# EasyEDA Pro project YT9215S-5-port-switch.epro, board PCB1
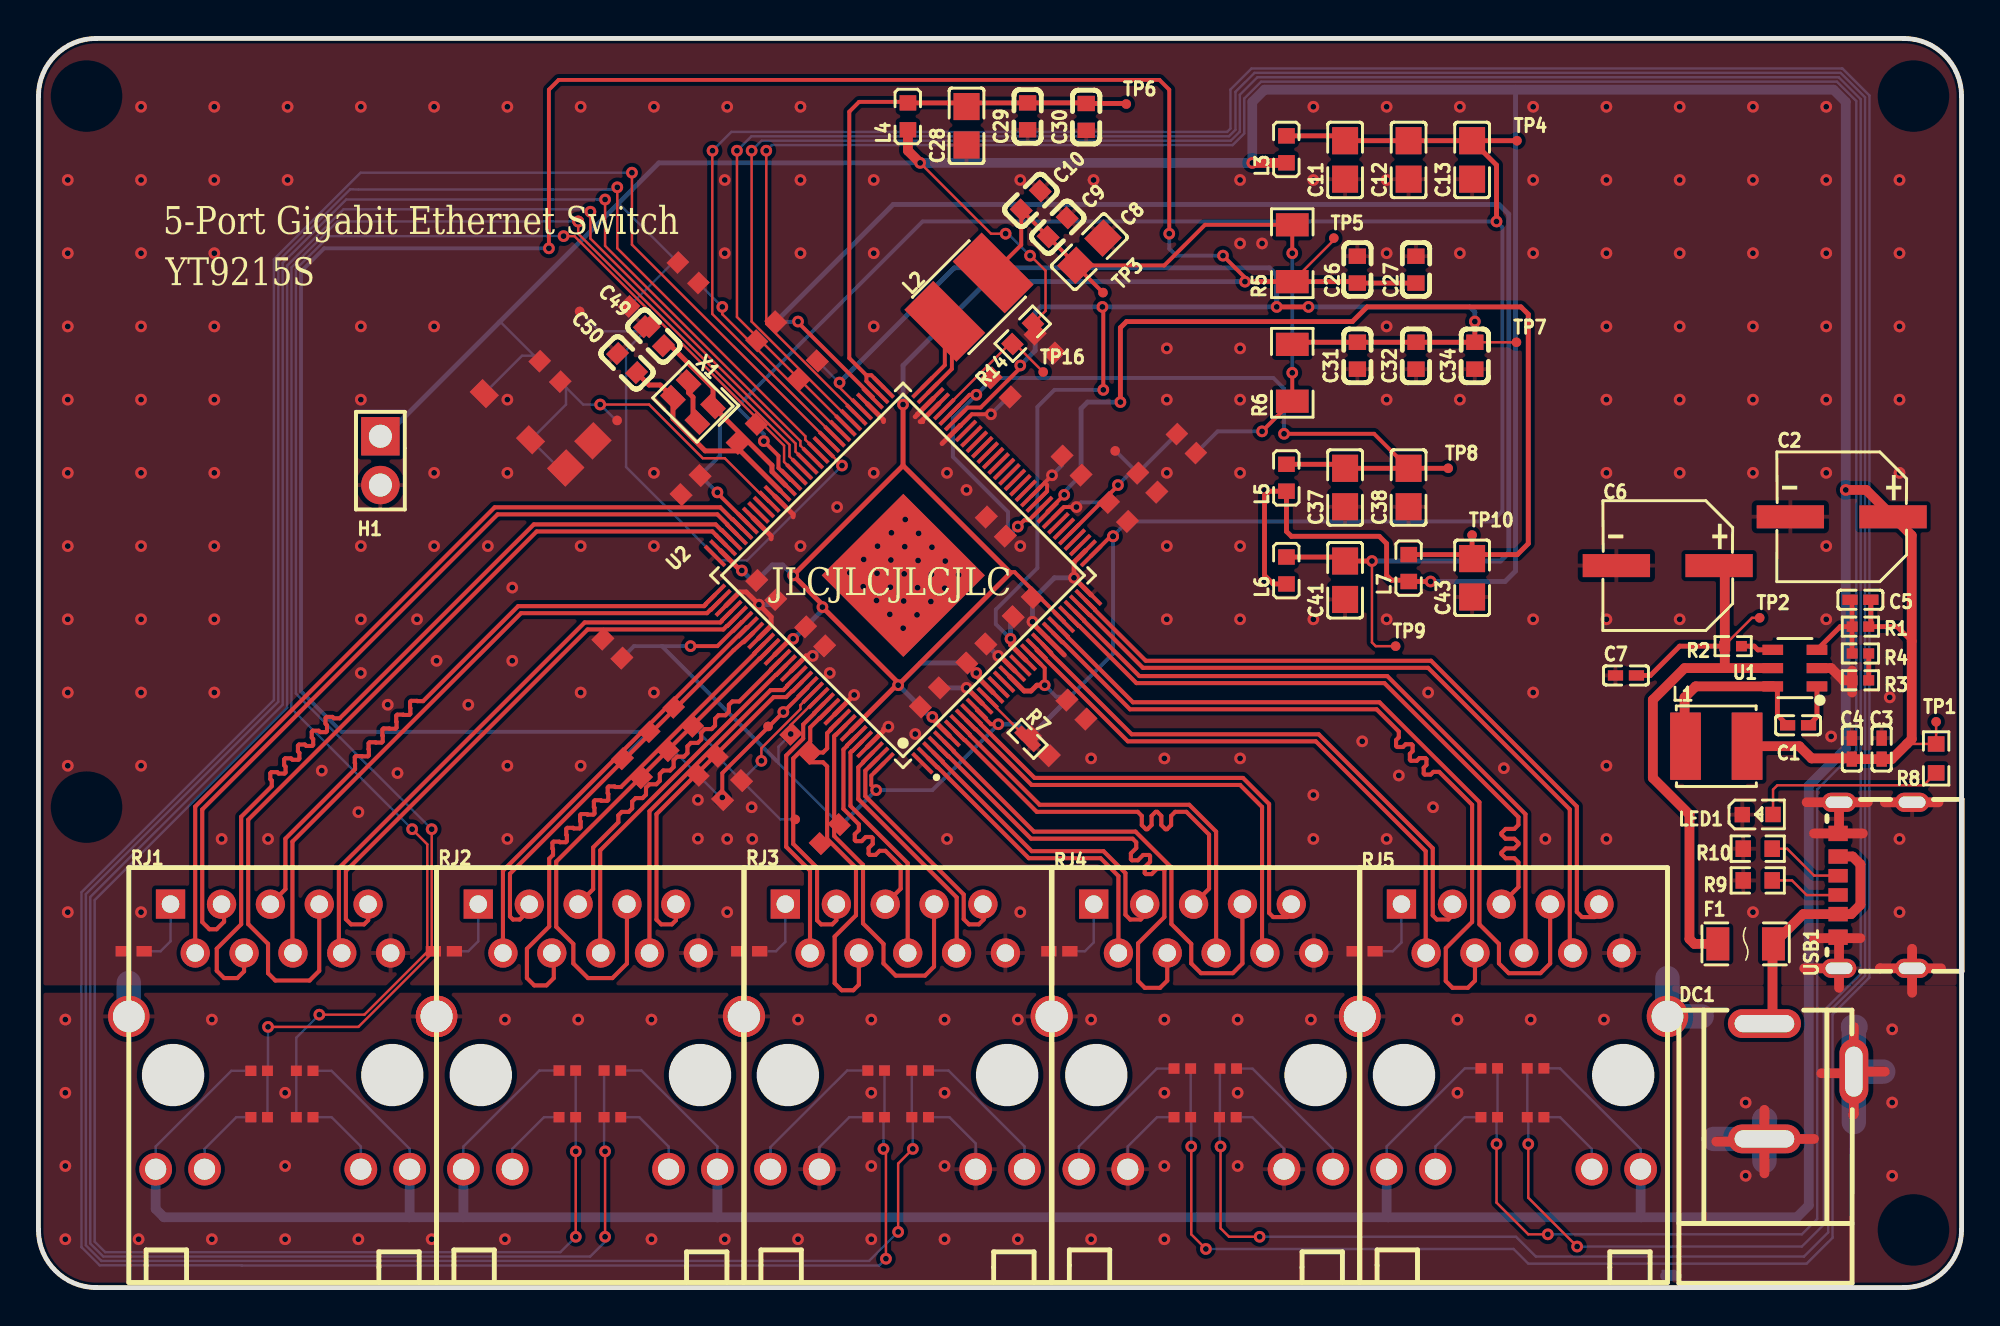
[diagram p2: board, top side]
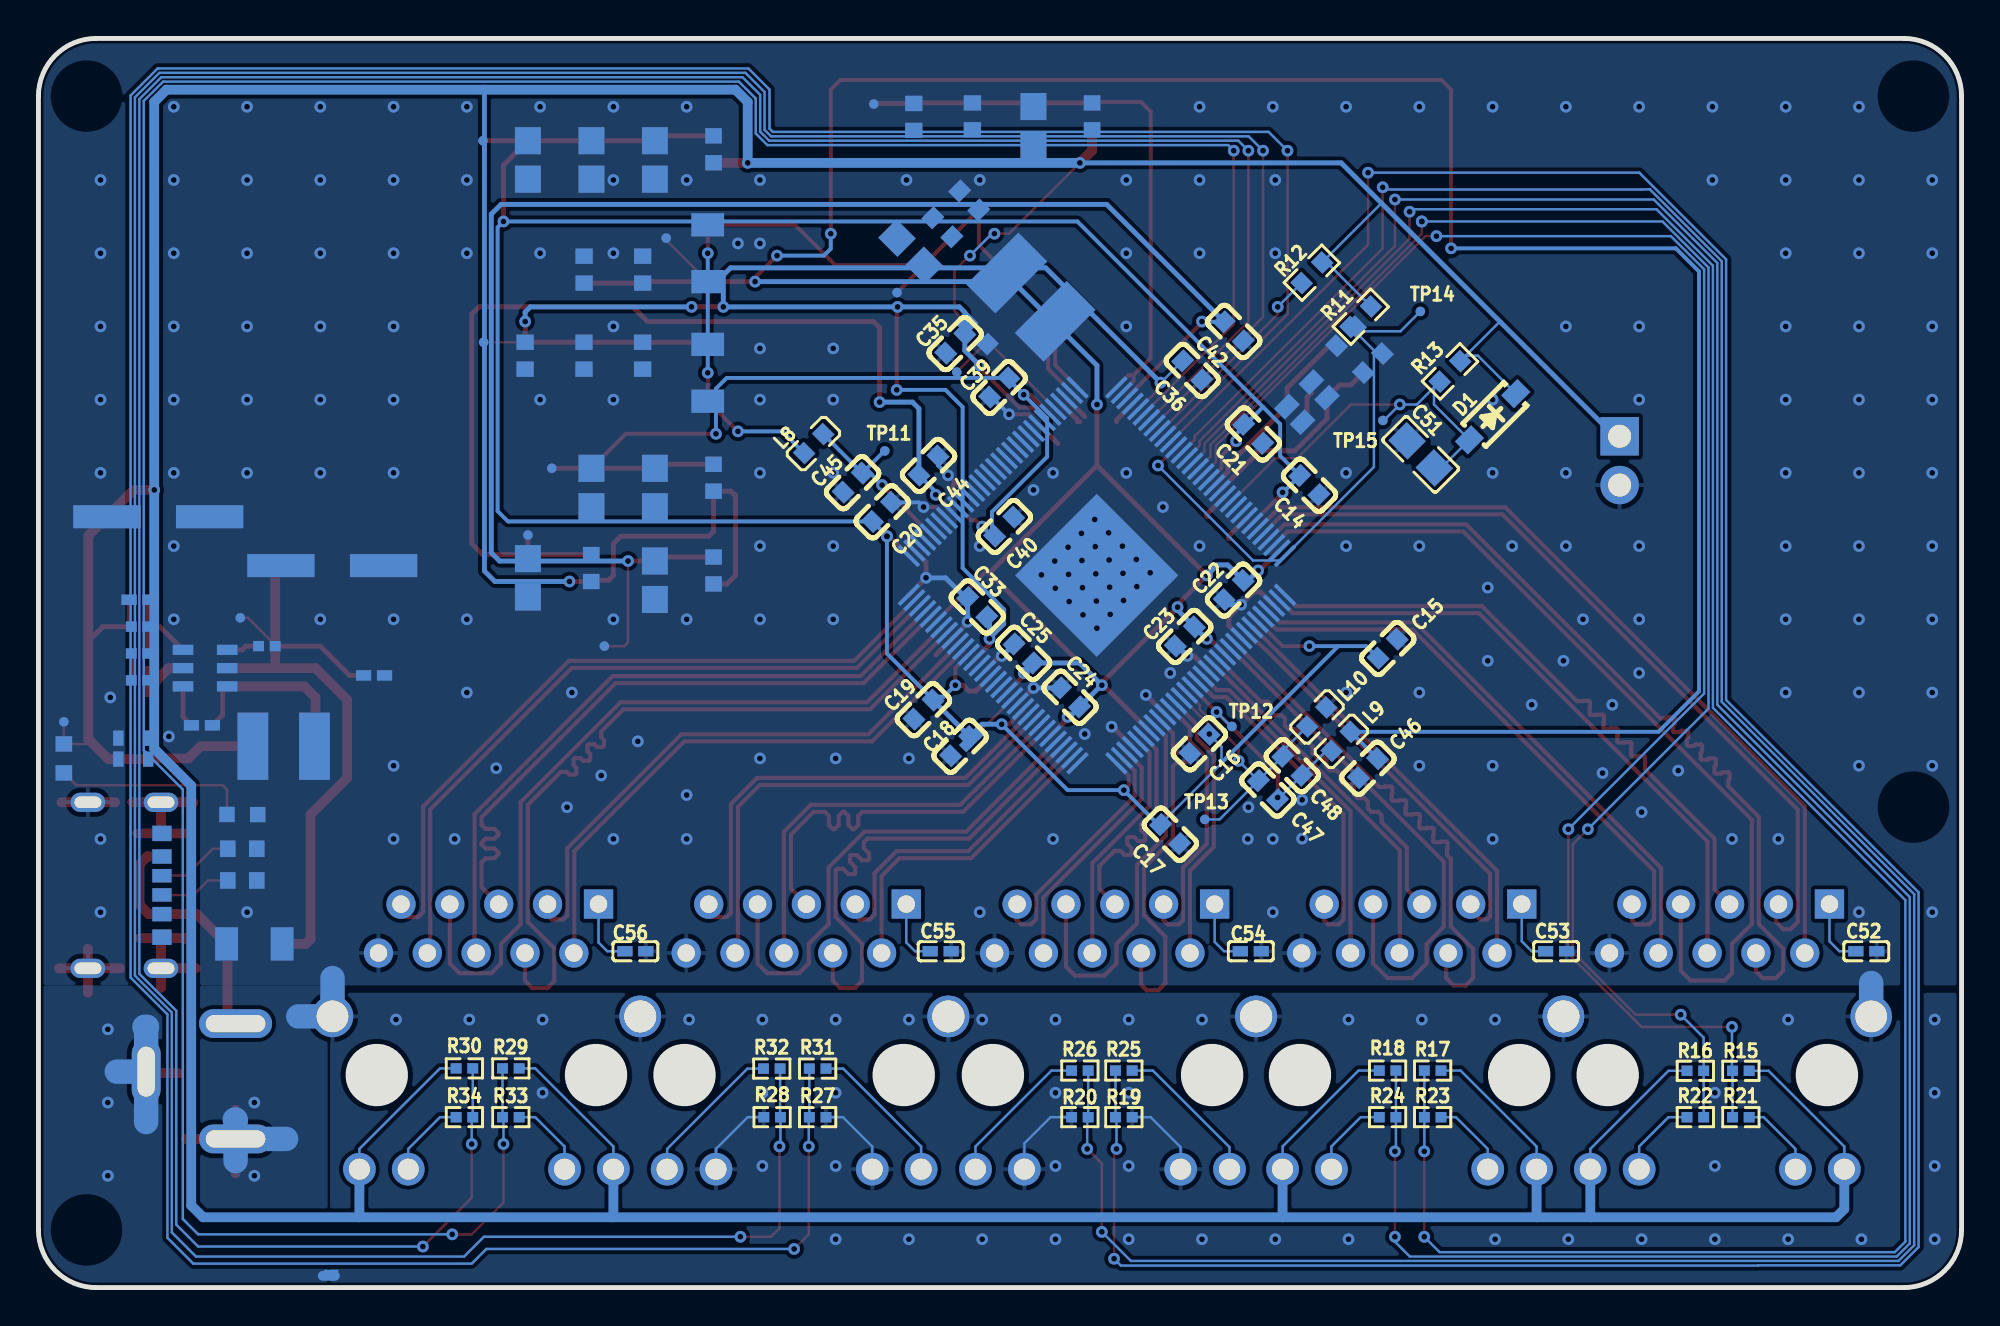
[diagram p3: board, bottom side, seen from below]

Outline 100 x 65 mm; copper layers: Top Layer, Bottom Layer. Coordinates in mm from the lower left corner of the outline.
Outline path: 0,62 0,3 arc(0.88,0.88) 3,0 97,0 arc(99.12,0.88) 100,3 100,62 arc(99.12,64.12) 97,65 3,65 arc(0.88,64.12) 0,62
Stack: Top Layer 0.035mm / Dielectric1 1.51mm FR4 er 4.5 / Bottom Layer 0.035mm

## Design rules (mm)
net P3MDIA_P: P3MDIA
net P3MDIA_N: P3MDIA
net P3MDIB_P: P3MDIB
net P3MDIB_N: P3MDIB
net P3MDIC_P: P3MDIC
net P3MDIC_N: P3MDIC
net P3MDID_P: P3MDID
net P3MDID_N: P3MDID
net P4MDIA_P: P4MDIA
net P4MDIA_N: P4MDIA
net P4MDIB_P: P4MDIB
net P4MDIB_N: P4MDIB
net P4MDIC_P: P4MDIC
net P4MDIC_N: P4MDIC
net P4MDID_P: P4MDID
net P4MDID_N: P4MDID
net P0MDIA_P: P0MDIA
net P0MDIA_N: P0MDIA
net P0MDIB_P: P0MDIB
net P0MDIB_N: P0MDIB
net P0MDIC_P: P0MDIC
net P0MDIC_N: P0MDIC
net P0MDID_P: P0MDID
net P0MDID_N: P0MDID
net P1MDIA_P: P1MDIA
net P1MDIA_N: P1MDIA
net P1MDIB_P: P1MDIB
net P1MDIB_N: P1MDIB
net P1MDIC_P: P1MDIC
net P1MDIC_N: P1MDIC
net P1MDID_P: P1MDID
net P1MDID_N: P1MDID
net P2MDIA_P: P2MDIA
net P2MDIA_N: P2MDIA
net P2MDIB_P: P2MDIB
net P2MDIB_N: P2MDIB
net P2MDIC_P: P2MDIC
net P2MDIC_N: P2MDIC
net P2MDID_P: P2MDID
net P2MDID_N: P2MDID
spacing copperThickness1oz (default): track to track 0.102, other pairs 0.152 to 0.3
spacing copperThickness2oz: track to track 0.203, other pairs 0.152 to 0.3
spacing Plane_innerPlane: track to track 0.102, other pairs 0.152 to 0.3
spacing Copper_copperRegion: track to track 0.102, other pairs 0.152 to 0.3
track width copperThickness1oz (default): min 0.127, default 0.254, max 2.54
track width copperThickness2oz: min 0.203, default 0.254, max 2.54
differential pair differentialPair (default): width min 0.127, default 0.254, max 2.54; gap min 0.152, default 0.152
differential pair 100欧姆共面差分阻抗匹配: width min 0.127, default 0.213, max 2.54; gap min 0.152, default 0.152
net 3V3 uses Copper_copperRegion, Plane_innerPlane
net AVDDH uses Copper_copperRegion, Plane_innerPlane
net $1N2005 uses Copper_copperRegion, Plane_innerPlane
net GND uses Copper_copperRegion, Plane_innerPlane
net $1N2999 uses Copper_copperRegion, Plane_innerPlane
net VDDL uses Copper_copperRegion, Plane_innerPlane
net AVDDL uses Copper_copperRegion, Plane_innerPlane
net DVDDL uses Copper_copperRegion, Plane_innerPlane
net DVDDIO_2 uses Copper_copperRegion, Plane_innerPlane
net DVDDIO uses Copper_copperRegion, Plane_innerPlane
net SVDDH uses Copper_copperRegion, Plane_innerPlane
net SVDDL uses Copper_copperRegion, Plane_innerPlane
net PLLVDDL uses Copper_copperRegion, Plane_innerPlane
net PLLGND uses Copper_copperRegion, Plane_innerPlane
net V_BUS uses Copper_copperRegion, Plane_innerPlane
net $1N9819 uses Copper_copperRegion, Plane_innerPlane
net $1N9816 uses Copper_copperRegion, Plane_innerPlane
net XTAL_IN uses Copper_copperRegion, Plane_innerPlane
net XTAL_OUT uses Copper_copperRegion, Plane_innerPlane
net HV_SWR uses Copper_copperRegion, Plane_innerPlane
net NRST uses Copper_copperRegion, Plane_innerPlane
net EN_SWR uses Copper_copperRegion, Plane_innerPlane
net VBUS uses Copper_copperRegion, Plane_innerPlane
net $1N10186 uses Copper_copperRegion, Plane_innerPlane
net DISAUTOLOAD uses Copper_copperRegion, Plane_innerPlane
net EN_PWRLIGHT uses Copper_copperRegion, Plane_innerPlane
net $1N4949 uses Copper_copperRegion, Plane_innerPlane
net $1N4948 uses Copper_copperRegion, Plane_innerPlane
net $1N4945 uses Copper_copperRegion, Plane_innerPlane
net $1N4947 uses Copper_copperRegion, Plane_innerPlane
net P3MDIA_P uses 100欧姆共面差分阻抗匹配, Copper_copperRegion, Plane_innerPlane
net P3MDIA_N uses 100欧姆共面差分阻抗匹配, Copper_copperRegion, Plane_innerPlane
net P3MDIB_P uses 100欧姆共面差分阻抗匹配, Copper_copperRegion, Plane_innerPlane
net P3MDIB_N uses 100欧姆共面差分阻抗匹配, Copper_copperRegion, Plane_innerPlane
net P3MDIC_P uses 100欧姆共面差分阻抗匹配, Copper_copperRegion, Plane_innerPlane
net P3MDIC_N uses 100欧姆共面差分阻抗匹配, Copper_copperRegion, Plane_innerPlane
net P3MDID_P uses 100欧姆共面差分阻抗匹配, Copper_copperRegion, Plane_innerPlane
net P3MDID_N uses 100欧姆共面差分阻抗匹配, Copper_copperRegion, Plane_innerPlane
net P4MDIA_P uses 100欧姆共面差分阻抗匹配, Copper_copperRegion, Plane_innerPlane
net P4MDIA_N uses 100欧姆共面差分阻抗匹配, Copper_copperRegion, Plane_innerPlane
net P4MDIB_P uses 100欧姆共面差分阻抗匹配, Copper_copperRegion, Plane_innerPlane
net P4MDIB_N uses 100欧姆共面差分阻抗匹配, Copper_copperRegion, Plane_innerPlane
net P4MDIC_P uses 100欧姆共面差分阻抗匹配, Copper_copperRegion, Plane_innerPlane
net P4MDIC_N uses 100欧姆共面差分阻抗匹配, Copper_copperRegion, Plane_innerPlane
net P4MDID_P uses 100欧姆共面差分阻抗匹配, Copper_copperRegion, Plane_innerPlane
net P4MDID_N uses 100欧姆共面差分阻抗匹配, Copper_copperRegion, Plane_innerPlane
net P4_LED0 uses Copper_copperRegion, Plane_innerPlane
net P4_LED1 uses Copper_copperRegion, Plane_innerPlane
net P3_LED1 uses Copper_copperRegion, Plane_innerPlane
net P3_LED0 uses Copper_copperRegion, Plane_innerPlane
net P2_LED0 uses Copper_copperRegion, Plane_innerPlane
net P2_LED1 uses Copper_copperRegion, Plane_innerPlane
net P1_LED1 uses Copper_copperRegion, Plane_innerPlane
net P1_LED0 uses Copper_copperRegion, Plane_innerPlane
net P0_LED1 uses Copper_copperRegion, Plane_innerPlane
net P0_LED0 uses Copper_copperRegion, Plane_innerPlane
net P0MDIA_P uses 100欧姆共面差分阻抗匹配, Copper_copperRegion, Plane_innerPlane
net P0MDIA_N uses 100欧姆共面差分阻抗匹配, Copper_copperRegion, Plane_innerPlane
net P0MDIB_P uses 100欧姆共面差分阻抗匹配, Copper_copperRegion, Plane_innerPlane
net P0MDIB_N uses 100欧姆共面差分阻抗匹配, Copper_copperRegion, Plane_innerPlane
net P0MDIC_P uses 100欧姆共面差分阻抗匹配, Copper_copperRegion, Plane_innerPlane
net P0MDIC_N uses 100欧姆共面差分阻抗匹配, Copper_copperRegion, Plane_innerPlane
net P0MDID_P uses 100欧姆共面差分阻抗匹配, Copper_copperRegion, Plane_innerPlane
net P0MDID_N uses 100欧姆共面差分阻抗匹配, Copper_copperRegion, Plane_innerPlane
net P1MDIA_P uses 100欧姆共面差分阻抗匹配, Copper_copperRegion, Plane_innerPlane
net P1MDIA_N uses 100欧姆共面差分阻抗匹配, Copper_copperRegion, Plane_innerPlane
net P1MDIB_P uses 100欧姆共面差分阻抗匹配, Copper_copperRegion, Plane_innerPlane
net P1MDIB_N uses 100欧姆共面差分阻抗匹配, Copper_copperRegion, Plane_innerPlane
net P1MDIC_P uses 100欧姆共面差分阻抗匹配, Copper_copperRegion, Plane_innerPlane
net P1MDIC_N uses 100欧姆共面差分阻抗匹配, Copper_copperRegion, Plane_innerPlane
net P1MDID_P uses 100欧姆共面差分阻抗匹配, Copper_copperRegion, Plane_innerPlane
net P1MDID_N uses 100欧姆共面差分阻抗匹配, Copper_copperRegion, Plane_innerPlane
net P2MDIA_P uses 100欧姆共面差分阻抗匹配, Copper_copperRegion, Plane_innerPlane
net P2MDIA_N uses 100欧姆共面差分阻抗匹配, Copper_copperRegion, Plane_innerPlane
net P2MDIB_P uses 100欧姆共面差分阻抗匹配, Copper_copperRegion, Plane_innerPlane
net P2MDIB_N uses 100欧姆共面差分阻抗匹配, Copper_copperRegion, Plane_innerPlane
net P2MDIC_P uses 100欧姆共面差分阻抗匹配, Copper_copperRegion, Plane_innerPlane
net P2MDIC_N uses 100欧姆共面差分阻抗匹配, Copper_copperRegion, Plane_innerPlane
net P2MDID_P uses 100欧姆共面差分阻抗匹配, Copper_copperRegion, Plane_innerPlane
net P2MDID_N uses 100欧姆共面差分阻抗匹配, Copper_copperRegion, Plane_innerPlane
net $1N4938 uses Copper_copperRegion, Plane_innerPlane
net $2N653 uses Copper_copperRegion, Plane_innerPlane
net $2N647 uses Copper_copperRegion, Plane_innerPlane
net $2N645 uses Copper_copperRegion, Plane_innerPlane
net $2N1084 uses Copper_copperRegion, Plane_innerPlane
net $2N1078 uses Copper_copperRegion, Plane_innerPlane
net $2N1076 uses Copper_copperRegion, Plane_innerPlane
net $2N1523 uses Copper_copperRegion, Plane_innerPlane
net $2N6555 uses Copper_copperRegion, Plane_innerPlane
net $2N6448 uses Copper_copperRegion, Plane_innerPlane
net $2N1954 uses Copper_copperRegion, Plane_innerPlane
net $2N6593 uses Copper_copperRegion, Plane_innerPlane
net $2N6531 uses Copper_copperRegion, Plane_innerPlane
net $2N2385 uses Copper_copperRegion, Plane_innerPlane
net $2N2379 uses Copper_copperRegion, Plane_innerPlane
net $2N2377 uses Copper_copperRegion, Plane_innerPlane
diff pair P3MDIA uses 100欧姆共面差分阻抗匹配
diff pair P3MDIB uses 100欧姆共面差分阻抗匹配
diff pair P3MDIC uses 100欧姆共面差分阻抗匹配
diff pair P3MDID uses 100欧姆共面差分阻抗匹配
diff pair P4MDIA uses 100欧姆共面差分阻抗匹配
diff pair P4MDIB uses 100欧姆共面差分阻抗匹配
diff pair P4MDIC uses 100欧姆共面差分阻抗匹配
diff pair P4MDID uses 100欧姆共面差分阻抗匹配
diff pair P0MDIA uses 100欧姆共面差分阻抗匹配
diff pair P0MDIB uses 100欧姆共面差分阻抗匹配
diff pair P0MDIC uses 100欧姆共面差分阻抗匹配
diff pair P0MDID uses 100欧姆共面差分阻抗匹配
diff pair P1MDIA uses 100欧姆共面差分阻抗匹配
diff pair P1MDIB uses 100欧姆共面差分阻抗匹配
diff pair P1MDIC uses 100欧姆共面差分阻抗匹配
diff pair P1MDID uses 100欧姆共面差分阻抗匹配
diff pair P2MDIA uses 100欧姆共面差分阻抗匹配
diff pair P2MDIB uses 100欧姆共面差分阻抗匹配
diff pair P2MDIC uses 100欧姆共面差分阻抗匹配
diff pair P2MDID uses 100欧姆共面差分阻抗匹配
pour e1845 uses Copper_copperRegion
pour e2004 uses Copper_copperRegion
pour e2045 uses Copper_copperRegion
pour e2162 uses Copper_copperRegion
pour e2218 uses Copper_copperRegion
pour e2228 uses Copper_copperRegion

## Placement (name value [footprint] x y rotation side)
C1  22nF  [C0402]  91.5 29.26 180 top
C2  220uF  [CAP-SMD_BD6.3-L6.6-W6.6-LS7.4-FD]  93.77 40.11 180 top
C3  100nF  [C0402]  95.84 28.04 270 top
C4  10nF  [C0402]  94.3 28.04 270 top
C5  22pF  [C0402]  94.74 35.79 180 top
C6  220uF  [CAP-SMD_BD6.3-L6.6-W6.6-LS7.4-FD]  84.72 37.57 180 top
C7  100nF  [C0402]  82.55 31.85 0 top
C8  10uF  [C0805]  54.65 53.9 225 top
C9  10nF  [C0603]  53 55.17 225 top
C10  100nF  [C0603]  51.6 56.57 225 top
C11  10uF  [C0805]  67.94 58.68 90 top
C12  10uF  [C0805]  71.25 58.68 90 top
C13  10uF  [C0805]  74.55 58.68 90 top
C14  10nF  [C0603]  33.91 41.76 45 bottom
C15  10nF  [C0603]  29.84 33.25 315 bottom
C16  10nF  [C0603]  39.62 28.3 135 bottom
C17  10nF  [C0603]  41.15 23.6 45 bottom
C18  10nF  [C0603]  52.07 28.17 135 bottom
C19  10nF  [C0603]  53.97 30.08 135 bottom
C20  10nF  [C0603]  56.13 40.36 315 bottom
C21  10nF  [C0603]  36.83 44.43 45 bottom
C22  10nF  [C0603]  37.85 36.3 135 bottom
C23  10nF  [C0603]  40.39 33.89 135 bottom
C24  10nF  [C0603]  46.35 30.71 225 bottom
C25  10nF  [C0603]  48.77 33 225 bottom
C26  10nF  [C0603]  68.58 52.97 270 top
C27  10nF  [C0603]  71.63 52.97 270 top
C28  10uF  [C0805]  48.26 60.46 90 top
C29  1uF  [C0603]  51.44 60.95 90 top
C30  10nF  [C0603]  54.48 60.92 90 top
C31  10nF  [C0603]  68.59 48.49 90 top
C32  10nF  [C0603]  71.63 48.49 90 top
C33  10nF  [C0603]  51.18 35.41 225 bottom
C34  10nF  [C0603]  74.69 48.49 90 top
C35  10nF  [C0603]  52.32 49.12 135 bottom
C36  10nF  [C0603]  40 47.73 45 bottom
C37  10uF  [C0805]  67.94 41.63 90 top
C38  10uF  [C0805]  71.25 41.63 90 top
C39  10nF  [C0603]  50.04 46.84 135 bottom
C40  10nF  [C0603]  49.78 39.6 315 bottom
C41  10uF  [C0805]  67.94 36.81 90 top
C42  10nF  [C0603]  37.85 49.76 45 bottom
C43  10uF  [C0805]  74.55 36.93 90 top
C44  10nF  [C0603]  53.72 42.78 315 bottom
C45  10nF  [C0603]  57.66 41.89 135 bottom
C46  100nF  [C0603]  30.86 27.03 135 bottom
C47  1uF  [C0603]  36.07 25.88 225 bottom
C48  1nF  [C0603]  34.8 27.15 225 bottom
C49  4pF  [C0603]  32 49.51 315 top
C50  4pF  [C0603]  30.61 48.11 315 top
C51  10uF  [C0805]  28.12 43.36 225 bottom
C52  100nF  [C0402]  4.95 17.5 0 bottom
C53  100nF  [C0402]  21.08 17.5 0 bottom
C54  100nF  [C0402]  36.96 17.5 0 bottom
C55  100nF  [C0402]  53.09 17.5 0 bottom
C56  100nF  [C0402]  68.96 17.5 0 bottom
D1  1N4148WQ  [SOD-123_L2.7-W1.6-LS3.7-RD-1]  24.38 45.31 315 bottom
DC1  DC-005-20A  [DC-IN-TH_DC-005-20A]  92.07 10.74 90 top
F1  BSMD1206-075-30V  [F1206]  88.77 17.88 180 top
H1  PZ254V-11-02P  [HDR-TH_2P-P2.54-V-M]  17.78 43.03 270 top
L1  4.7uH  [IND-SMD_L4.0-W4.0]  87.25 28.17 0 top
L2  2.2uH  [IND-SMD_L4.0-W4.0_SWPA4018S]  48.39 51.54 225 top
L3  BLM18KG221SN1D  [L0603]  64.9 59.23 90 top
L4  BLM18KG221SN1D  [L0603]  45.21 60.95 90 top
L5  BLM18KG221SN1D  [L0603]  64.9 42.14 90 top
L6  BLM18KG221SN1D  [L0603]  64.9 37.31 90 top
L7  BLM18KG221SN1D  [L0603]  71.26 37.44 90 top
L8  BLM18KG221SN1D  [L0603]  59.69 43.92 135 bottom
L9  BLM18KG221SN1D  [L0603]  32.26 28.42 315 bottom
L10  BLM18KG221SN1D  [L0603]  33.53 29.69 315 bottom
LED1  NCD0603W1  [LED0603-RD]  89.4 24.61 0 top
NOREF  -  [Pad_e346]  44.97 37.06 45 top
R1  18kΩ  [R0402]  94.74 34.39 180 top
R2  10kΩ  [R0402]  88.12 33.38 0 top
R3  2kΩ  [R0402]  94.74 31.6 180 top
R4  2kΩ  [R0402]  94.74 33 0 top
R5  0Ω  [R1206]  65.2 53.82 270 top
R6  0Ω  [R1206]  65.2 47.6 90 top
R7  2.49kΩ  [R0402]  51.44 28.55 135 top
R8  150Ω  [R0603]  98.68 27.53 270 top
R9  5.1kΩ  [R0603]  89.4 21.19 180 top
R10  5.1kΩ  [R0603]  89.4 22.84 0 top
R11  4.7kΩ  [R0603]  31.24 50.52 135 bottom
R12  4.7kΩ  [R0603]  33.78 52.81 135 bottom
R13  4.7kΩ  [R0603]  26.6 47.67 135 bottom
R14  4.7kΩ  [R0603]  51.18 49.63 45 top
R15  4.7kΩ  [R0402]  11.48 11.28 180 bottom
R16  4.7kΩ  [R0402]  13.84 11.28 0 bottom
R17  4.7kΩ  [R0402]  27.5 11.29 180 bottom
R18  4.7kΩ  [R0402]  29.84 11.29 0 bottom
R19  4.7kΩ  [R0402]  43.56 8.87 180 bottom
R20  4.7kΩ  [R0402]  45.85 8.87 0 bottom
R21  470Ω  [R0402]  11.48 8.87 180 bottom
R22  470Ω  [R0402]  13.84 8.87 180 bottom
R23  470Ω  [R0402]  27.5 8.87 180 bottom
R24  470Ω  [R0402]  29.84 8.87 180 bottom
R25  470Ω  [R0402]  43.56 11.29 180 bottom
R26  470Ω  [R0402]  45.85 11.29 180 bottom
R27  4.7kΩ  [R0402]  59.48 8.87 180 bottom
R28  4.7kΩ  [R0402]  61.85 8.87 0 bottom
R29  4.7kΩ  [R0402]  75.44 11.41 180 bottom
R30  4.7kΩ  [R0402]  77.85 11.41 0 bottom
R31  470Ω  [R0402]  59.48 11.39 180 bottom
R32  470Ω  [R0402]  61.87 11.39 180 bottom
R33  470Ω  [R0402]  75.44 8.87 180 bottom
R34  470Ω  [R0402]  77.85 8.87 180 bottom
RJ1  HR911130A  [RJ45-TH_HR911130A]  12.7 13.06 180 top
RJ2  HR911130A  [RJ45-TH_HR911130A]  28.7 13.06 180 top
RJ3  HR911130A  [RJ45-TH_HR911130A]  44.67 13.06 180 top
RJ4  HR911130A  [RJ45-TH_HR911130A]  60.71 13.06 180 top
RJ5  HR911130A  [RJ45-TH_HR911130A]  76.71 13.06 180 top
TP1  -  [Test-Point-0.5mm]  98.68 29.44 0 top
TP2  -  [Test-Point-0.5mm]  89.5 34.85 0 top
TP3  -  [Test-Point-0.5mm]  55.35 51.77 0 top
TP4  -  [Test-Point-0.5mm]  76.88 59.68 0 top
TP5  -  [Test-Point-0.5mm]  67.36 54.61 0 top
TP6  -  [Test-Point-0.5mm]  56.57 61.59 0 top
TP7  -  [Test-Point-0.5mm]  76.85 49.19 0 top
TP8  -  [Test-Point-0.5mm]  73.31 42.63 0 top
TP9  -  [Test-Point-0.5mm]  70.57 33.38 0 top
TP10  -  [Test-Point-0.5mm]  74.55 39.16 0 top
TP11  -  [test-point-0.5mm]  55.99 43.54 180 bottom
TP12  -  [Test-Point-0.5mm]  37.94 29.2 180 bottom
TP13  -  [Test-Point-0.5mm]  39.35 24.36 180 bottom
TP14  -  [Test-Point-0.5mm]  28.14 50.79 180 bottom
TP15  -  [Test-Point-0.5mm]  30.09 45.12 225 bottom
TP16  -  [Test-Point-0.5mm]  52.25 47.64 0 top
U1  MT2492  [SOT-23-6_L2.9-W1.6-P0.95-LS2.8-BL]  91.33 32.23 90 top
U2  RTL8367S-CG  [LQFP-128_L14.0-W14.0-P0.40-LS16.0-BL]  44.96 37.06 45 top
USB1  TYPE-C 6P(040新)  [USB-C-SMD_TYPE-C-6P]  95.5 20.93 90 top
X1  -  [CRYSTAL-SMD_4P-L2.0-W1.6-BL]  34.04 46.08 135 top

## Footprints (pads in the part's own frame, mm; a bottom-side part is the same pattern mirrored in y, then rotated)
C0402
  rect 0.79x0.54 hole 0.001: 1(-0.545,0) 2(0.545,0)
C0603
  rect 0.8x0.9 hole 0.001: 1(-0.7,0) 2(0.7,0)
C0805
  rect 1.41x1.35 hole 0.001: 1(-1,0) 2(1,0)
CAP-SMD_BD6.3-L6.6-W6.6-LS7.4-FD
  rect 3.5x1.2 hole 0.001: 1(-2.67,0) 2(2.67,0)
CRYSTAL-SMD_4P-L2.0-W1.6-BL
  rect 1.1x0.8 hole 0.001: 1(-0.9,-0.575) 2(0.9,-0.575) 3(0.9,0.575) 4(-0.9,0.575)
DC-IN-TH_DC-005-20A
  oval 1.5x3.8 hole 0.9x3.1: 1(3,2.325) 2(-3,2.325)
  oval 3.4x1.5 hole 2.6x0.9: 3(0.5,-2.325)
F1206
  rect 1.19x1.728 hole 0.001: 1(-1.445,0) 2(1.445,0)
HDR-TH_2P-P2.54-V-M
  rect 2x2 hole 1.2: 1(-1.27,0)
  round 2 hole 1.2: 2(1.27,0)
IND-SMD_L4.0-W4.0
  rect 1.6x3.5 hole 0.001: 1(-1.6,0) 2(1.6,0)
IND-SMD_L4.0-W4.0_SWPA4018S
  rect 2.124x3.82 hole 0.001: 1(1.778,0) 2(-1.778,0)
L0603
  rect 0.8x0.864 hole 0.001: 1(-0.7,0) 2(0.7,0)
LED0603-RD
  rect 0.8x0.8 hole 0.001: 1(-0.799,-0.004) 2(0.799,0.004)
LQFP-128_L14.0-W14.0-P0.40-LS16.0-BL
  rect 0.2x1.46 hole 0.001: 1(-6.2,-7.63) 2(-5.8,-7.63) 3(-5.4,-7.63) 4(-5,-7.63) 5(-4.6,-7.63) 6(-4.2,-7.63) 7(-3.8,-7.63) 8(-3.4,-7.63) 9(-3,-7.63) 10(-2.6,-7.63) 11(-2.2,-7.63) 12(-1.8,-7.63) 13(-1.4,-7.63) 14(-1,-7.63) 15(-0.6,-7.63) 16(-0.2,-7.63) 17(0.2,-7.63) 18(0.6,-7.63) 19(1,-7.63) 20(1.4,-7.63) 21(1.8,-7.63) 22(2.2,-7.63) 23(2.6,-7.63) 24(3,-7.63) 25(3.4,-7.63) 26(3.8,-7.63) 27(4.2,-7.63) 28(4.6,-7.63) 29(5,-7.63) 30(5.4,-7.63) 31(5.8,-7.63) 32(6.2,-7.63) 65(6.2,7.63) 66(5.8,7.63) 67(5.4,7.63) 68(5,7.63) 69(4.6,7.63) 70(4.2,7.63) 71(3.8,7.63) 72(3.4,7.63) 73(3,7.63) 74(2.6,7.63) 75(2.2,7.63) 76(1.8,7.63) 77(1.4,7.63) 78(1,7.63) 79(0.6,7.63) 80(0.2,7.63) 81(-0.2,7.63) 82(-0.6,7.63) 83(-1,7.63) 84(-1.4,7.63) 85(-1.8,7.63) 86(-2.2,7.63) 87(-2.6,7.63) 88(-3,7.63) 89(-3.4,7.63) 90(-3.8,7.63) 91(-4.2,7.63) 92(-4.6,7.63) 93(-5,7.63) 94(-5.4,7.63) 95(-5.8,7.63) 96(-6.2,7.63)
  rect 1.46x0.2 hole 0.001: 33(7.63,-6.2) 34(7.63,-5.8) 35(7.63,-5.4) 36(7.63,-5) 37(7.63,-4.6) 38(7.63,-4.2) 39(7.63,-3.8) 40(7.63,-3.4) 41(7.63,-3) 42(7.63,-2.6) 43(7.63,-2.2) 44(7.63,-1.8) 45(7.63,-1.4) 46(7.63,-1) 47(7.63,-0.6) 48(7.63,-0.2) 49(7.63,0.2) 50(7.63,0.6) 51(7.63,1) 52(7.63,1.4) 53(7.63,1.8) 54(7.63,2.2) 55(7.63,2.6) 56(7.63,3) 57(7.63,3.4) 58(7.63,3.8) 59(7.63,4.2) 60(7.63,4.6) 61(7.63,5) 62(7.63,5.4) 63(7.63,5.8) 64(7.63,6.2) 97(-7.63,6.2) 98(-7.63,5.8) 99(-7.63,5.4) 100(-7.63,5) 101(-7.63,4.6) 102(-7.63,4.2) 103(-7.63,3.8) 104(-7.63,3.4) 105(-7.63,3) 106(-7.63,2.6) 107(-7.63,2.2) 108(-7.63,1.8) 109(-7.63,1.4) 110(-7.63,1) 111(-7.63,0.6) 112(-7.63,0.2) 113(-7.63,-0.2) 114(-7.63,-0.6) 115(-7.63,-1) 116(-7.63,-1.4) 117(-7.63,-1.8) 118(-7.63,-2.2) 119(-7.63,-2.6) 120(-7.63,-3) 121(-7.63,-3.4) 122(-7.63,-3.8) 123(-7.63,-4.2) 124(-7.63,-4.6) 125(-7.63,-5) 126(-7.63,-5.4) 127(-7.63,-5.8) 128(-7.63,-6.2)
Pad_e346
  rect 6x6 hole 0.001: 129(0,0)
R0402
  rect 0.566x0.54 hole 0.001: 1(-0.433,0) 2(0.433,0)
R0603
  rect 0.806x0.864 hole 0.001: 1(-0.753,0) 2(0.753,0)
R1206
  rect 1.208x1.701 hole 0.001: 1(-1.479,0) 2(1.479,0)
RJ45-TH_HR911130A
  round 1.7 hole 1.1: 11(6.604,6.898) 12(4.064,6.898) 13(-4.064,6.898) 14(-6.604,6.898)
  rect 1.524x1.524 hole 0.91: P1(5.832,-6.898)
  round 1.524 hole 0.91: P2(4.549,-4.352) P3(3.18,-6.892) P4(2.009,-4.352) P5(0.64,-6.892) P6(-0.531,-4.352) P7(-1.9,-6.892) P8(-3.071,-4.352) P9(-4.44,-6.892) P10(-5.611,-4.352)
  round 2.159 hole 1.651: SHIELD0(-8.001,-1.052) SHIELD1(8.001,-1.052)
SOD-123_L2.7-W1.6-LS3.7-RD-1
  rect 1.2x0.95 hole 0.001: 1(-1.7,0) 2(1.7,0)
SOT-23-6_L2.9-W1.6-P0.95-LS2.8-BL
  rect 0.532x1.072 hole 0.001: 1(-0.95,-1.149) 2(0,-1.149) 3(0.95,-1.149) 4(0.95,1.149) 5(0,1.149) 6(-0.95,1.149)
Test-Point-0.5mm
  round 0.5 hole 0.001: 1(0,0)
test-point-0.5mm
  round 0.5 hole 0.001: 1(0,0)
USB-C-SMD_TYPE-C-6P
  oval 1x1.8 hole 0.6x1.4: 1(-4.32,1.875) 1(-4.32,-1.925) 2(4.32,1.875) 2(4.32,-1.925)
  rect 0.7x1 hole 0.001: A5(-0.499,1.925) B5(0.501,1.925)
  rect 0.75x1 hole 0.001: A9(1.501,1.925) B9(-1.499,1.925)
  rect 0.8x1 hole 0.001: A12(2.701,1.925) B12(-2.699,1.925)

## Nets
As in the schematic, except:
GND: C2.2 C3.1 C4.1 C6.2 C7.1 C8.1 C9.1 C10.1 C11.1 C12.1 C13.1 C14.1 C15.1 C16.1 C17.1 C18.1 C19.1 C20.1 C21.1 C22.1 C23.1 C24.1 C25.1 C26.1 C27.1 C28.1 C29.1 C30.1 C31.1 C32.1 C33.1 C34.1 C35.1 C36.1 C37.1 C38.1 C39.1 C40.1 C41.1 C42.1 C43.1 C44.1 C45.1 C46.1 C49.1 C50.1 C51.1 C52.1 C53.1 C54.1 C55.1 C56.1 DC1.2 DC1.3 H1.2 L10.1 LED1.1 NOREF.129 R3.2 R7.1 R9.2 R10.1 R19.2 R20.2 R27.2 R28.2 RJ1.P10 RJ1.SHIELD0 RJ1.SHIELD1 RJ2.P10 RJ2.SHIELD0 RJ2.SHIELD1 RJ3.12 RJ3.13 RJ3.P10 RJ3.SHIELD0 RJ3.SHIELD1 RJ4.12 RJ4.13 RJ4.P10 RJ4.SHIELD0 RJ4.SHIELD1 RJ5.P10 RJ5.SHIELD0 RJ5.SHIELD1 U1.2 U2.1 U2.12 U2.18 U2.24 U2.32 U2.34 U2.40 U2.43 U2.44 U2.57 U2.61 U2.62 U2.68 U2.85 U2.89 U2.96 U2.99 U2.105 U2.111 U2.119 U2.125 USB1.1 USB1.2 USB1.A12 USB1.B12 X1.2 X1.4

Pads without a net: U2 15 16 19 35 36 38 39 45 46 47 48 49 50 51 52 53 54 55 56 87 88

## Via types
v1: diameter 0.61, hole 0.305, Top Layer to Bottom Layer, 345 vias

## Routing (per net, layer and track width the routed paths; a pad name or vN(x,y) marks a point on that pad's centre or on a via; arc(x,y) is an arc through that point)
3V3: length 400.7
  Top Layer w0.127: 97.16,28.29 R8.1 TP1.1 ; v1(45.85,58.52) 49.53,54.84 v1(50.29,54.84) ; R14.2 52.37,50.82 52.37,52.92 51.59,53.7 v1(51.56,53.7)
  Top Layer w0.254: 97.41,33.63 96.65,34.39 95.18,34.39 95.29,34.51 95.29,35.79 ; L6.1 64.2,36.61 63.75,37.06 63.75,41.25 63.82,41.25 64.01,41.44 L5.1 64.9,39.35 65.15,39.09 69.72,39.09 70.1,38.71 70.1,37.06 70.36,36.81 71.19,36.81 L7.1 v1(72.39,36.74)
  Top Layer w0.508: v1(63.12,58.52) 64.89,58.52 L3.1 ; v1(45.85,58.52) 45.21,59.16 L4.1 ; L1.2 91.57,28.17 92.2,27.53 94.26,27.53 C4.2 C3.2 96.37,27.5 97.16,28.29 97.41,28.54 97.41,39.14 95.04,41.5 v1(93.98,41.5)
  Bottom Layer w0.127: R16.2 15.24,11.28 19.3,7.22 RJ1.14 ; 23.18,46.52 23.18,46.53 25.15,48.49 25.78,48.49 ; 23.97,50.23 24.04,50.23 25.78,48.49 ; R11.2 33,53.34 R12.2 30.16,56.43 ; R29.2 74.17,11.41 70.1,7.34 RJ5.11 ; R17.2 26.05,11.29 22.1,7.34 RJ2.11 ; R13.2 25.78,48.49 ; R30.2 79.12,11.41 83.31,7.22 RJ5.14 ; v1(51.56,53.7) 50.42,54.84 v1(50.29,54.84) ; 11.04,11.28 10.03,11.28 6.1,7.34 RJ1.11 ; RJ2.14 35.31,7.34 31.36,11.29 R18.2
  Bottom Layer w0.254: 76.81,62.33 76.81,37.29 76.26,36.74 v1(72.39,36.74) ; 17.78,44.3 18.03,44.3 32.26,58.52 v1(45.85,58.52)
  Bottom Layer w0.508: 70.19,3.66 35.31,3.66 ; 70.19,3.66 70.1,3.75 RJ5.11 ; 70.19,3.66 83.34,3.66 ; 35.31,3.66 35.31,3.66 RJ2.14 ; 35.31,3.66 22.08,3.66 ; 19.28,3.66 6.52,3.66 6.1,4.09 RJ1.11 ; 19.28,3.66 22.08,3.66 ; 19.28,3.66 19.3,3.68 RJ1.14 ; RJ2.11 22.1,3.68 22.08,3.66 ; 83.34,3.66 83.31,3.69 RJ5.14 ; 83.34,3.66 91.44,3.66 92.06,4.28 92.06,26.12 93.98,28.04 v1(93.98,41.5) 93.98,61.7 93.34,62.33 63.75,62.33 63.12,61.7 v1(63.12,58.52) v1(45.85,58.52)
AVDDH: length 168.5
  Top Layer w0.127: v1(39.12,28.81) 39.12,29.27 40.52,30.67 40.55,30.67
  Top Layer w0.203: U2.11 48.8,30.05 49.53,29.31 v1(49.91,29.31) ; v1(33.91,33.38) 35.31,33.38 36.56,34.63 U2.102 ; v1(52.32,31.34) 52.32,32.24 U2.21 ; v1(35.31,41.38) 35.31,41.34 U2.90 ; 54.74,38.07 54.74,38.08 55.75,39.09 v1(55.88,39.09) ; 43.95,27.28 43.31,26.64 43.31,26.14 v1(43.56,25.88) ; v1(37.72,44.05) 38.48,43.28 38.48,42.65 39.1,42.03 39.14,42.03
  Top Layer w0.254: C13.2 75.82,58.41 v1(75.82,55.47) ; C13.2 TP4.1 ; C13.2 C12.2 C11.2 67.69,59.93 L3.2 ; U2.17 51.26,31.04 51.62,31.04 51.92,31.34 v1(52.32,31.34)
  Bottom Layer w0.127: 38.48,27.28 41.64,24.12 41.64,24.09 ; 38.48,27.28 38.38,27.38 38.38,27.41 ; 38.48,27.28 38.48,28.14 39.13,28.79 v1(39.12,28.81)
  Bottom Layer w0.203: 32.41,33.38 v1(33.91,33.38) ; 32.41,33.38 38.38,27.41 ; 32.41,33.38 30.96,33.38 C15.2 ; 37.32,44.81 37.72,44.41 v1(37.72,44.05) ; v1(52.32,31.34) 52.92,30.75 53.63,30.75 ; 53.63,30.75 55.88,33 v1(55.88,39.09) 55.88,39.12 C20.2 75.59,39.87 76.12,40.4 76.12,55.17 v1(75.82,55.47) 45.97,55.47 36.32,45.82 ; 53.63,30.75 53.48,30.6 C19.2 ; v1(35.31,41.38) 35.28,41.38 C14.2 35.43,43.28 35.43,44.93 36.32,45.82 ; 36.32,45.82 37.22,44.92 ; v1(49.91,29.31) 46.48,25.88 v1(43.56,25.88) 41.77,24.09 41.64,24.09
  Bottom Layer w0.254: v1(49.91,29.31) 50.93,29.31 C18.2 C19.2
AVDDL: length 205.2
  Top Layer w0.127: TP5.1 67.36,54.51 R5.2
  Top Layer w0.203: v1(26.54,54.08) 26.54,62.33 27.05,62.84 58.29,62.84 58.8,62.33 v1(58.8,54.84) ; U2.27 53.32,34.66 50.76,37.23 50.5,37.23 ; v1(61.59,53.7) 62.74,52.55 v1(62.74,52.34)
  Top Layer w0.254: v1(40.77,35.41) 40.72,35.36 ; 40.72,35.36 40.72,35.58 v1(39.24,37.06) 44.96,42.78 ; 40.72,35.36 40.82,35.36 44.7,31.47 ; 44.96,42.78 v1(44.96,45.95) ; 44.96,42.78 50.5,37.23 ; v1(39.24,33.76) 39.14,33.65 39,33.65 U2.108 ; U2.14 48.77,31.84 v1(48.77,31.98) ; 44.7,31.47 v1(44.7,31.34) 44.62,31.34 U2.122 ; 44.7,31.47 44.83,31.47 50.57,37.21 ; 47.38,28.69 46.67,29.41 46.67,29.51 v1(46.48,29.69) ; v1(62.74,52.34) R5.2 68.5,52.34 C26.2 C27.2 ; U2.95 36.5,37.31 v1(36.58,37.31)
  Bottom Layer w0.203: v1(26.54,54.08) 14.86,54.08 13.65,52.88 13.65,31.02 15.76,28.92 31.76,28.92 C46.2 ; v1(61.59,53.7) 59.16,53.7 58.8,54.06 v1(58.8,54.84)
  Bottom Layer w0.254: v1(39.24,37.06) 38.7,37.6 38.16,37.6 C22.2 37.1,36.79 v1(36.58,37.31) ; v1(62.74,52.34) 49.32,52.34 44.96,47.98 v1(44.96,45.95) ; v1(39.24,33.76) 39.27,33.76 C23.2 40.77,35.26 v1(40.77,35.41) ; v1(48.77,31.98) 48.77,32.01 48.27,32.5 45.86,32.5 v1(44.7,31.34) 44.73,31.34 C24.2 46.38,29.69 v1(46.48,29.69)
DVDDIO: length 82.6
  Top Layer w0.127: v1(69.34,37.81) 69.34,33.57 69.54,33.38 TP9.1
  Top Layer w0.203: 43.38,46.27 43.38,46.34 39.5,50.22 v1(39.5,50.27)
  Top Layer w0.254: v1(69.34,37.81) C41.2 67.74,38.01 L6.2
  Bottom Layer w0.203: v1(39.5,50.27) 39.48,50.25 38.34,50.25
  Bottom Layer w0.254: v1(69.34,37.81) 76.02,37.81 76.45,38.24 76.45,55.86 75.95,56.36 44.45,56.36 38.34,50.25
DVDDIO_2: length 48.2
  Top Layer w0.203: 47.38,45.42 48.42,46.46 v1(48.77,46.46) ; v1(64.77,44.43) 69.45,44.43 C38.2 ; v1(50.93,39.6) 51.25,39.93 51.5,39.93 U2.42
  Top Layer w0.254: L5.2 67.74,42.84 C37.2 C38.2 TP8.1
  Bottom Layer w0.203: v1(64.77,44.43) 64.77,46.78 64.21,47.33 C39.2 49.54,47.23 v1(48.77,46.46) 47.55,45.24 47.55,43.23 50.42,40.36 50.42,39.25 50.28,39.11 50.43,39.11 v1(50.93,39.6)
DVDDL: length 98.7
  Top Layer w0.127: v1(41.66,47.09) 41.66,46.84 42.79,45.71 U2.69 ; C34.2 TP7.1
  Top Layer w0.203: v1(55.37,46.71) 55.37,51.03 ; U2.58 48.32,45.79 48.99,45.79 51.05,47.86 v1(51.05,47.98)
  Top Layer w0.254: R6.2 65.31,49.19 C31.2 C32.2 C34.2 v1(74.69,50.27) ; 51.34,32.66 50.55,33.45 v1(50.55,33.76) ; v1(66.04,51.03) v1(64.39,51.03) ; v1(55.32,51.03) 55.37,51.03
  Bottom Layer w0.127: v1(41.66,47.09) 41.63,47.09 40.5,48.22
  Bottom Layer w0.203: v1(50.55,33.76) 49.78,34.52 49.78,35.28 51.94,37.44 51.94,45.82 52.83,46.71 v1(55.37,46.71)
  Bottom Layer w0.254: v1(51.05,47.98) 51.83,48.76 51.83,50.75 52.11,51.03 v1(55.32,51.03) v1(64.39,51.03) 64.39,52.68 64.01,53.06 47.62,53.06 v1(41.66,47.09) ; v1(74.69,50.27) 74.69,50.76 74.42,51.03 v1(66.04,51.03) ; v1(50.55,33.76) 50.55,34.77 C33.2
GND: length 122.9
  Top Layer w0.203: v1(52.71,42.27) 52.33,41.9 ; v1(49.53,45.44) 48.53,45.44 47.95,44.86 ; U2.44 52.31,41.87 52.34,41.87 52.45,41.76 52.45,41.44 U2.43 ; U2.40 53.32,40.62 v1(53.97,40.62)
  Top Layer w0.254: 45.85,45.06 45.97,45.06 45.97,45.15 U2.61 ; v1(40.26,32.87) 39.92,32.87 39.14,32.09 ; 38.1,38.97 38.1,39.11 U2.89 ; U2.105 38.1,34.44 38.1,34.9 v1(37.47,35.54) 36.8,36.2 36.46,36.2 U2.99 ; U2.34 53.85,37.75 v1(53.85,36.93) 54.73,36.05 54.74,36.05 ; v1(42.42,30.84) 42.29,30.71 42.28,30.71 U2.119 ; 47.95,44.86 47.93,44.86 46.99,43.92 ; v1(49.91,32.87) 49.98,32.8 50.06,32.8 50.78,32.09 ; 43.94,45.06 43.94,45.15 U2.68 ; U2.125 43.94,28.97 43.94,29.06 ; X1.4 34.04,45.26 34.04,46.33 33.81,46.56 X1.2 ; U2.12 48.27,31.2 v1(48.26,31.2) ; 39.24,40.11 39.24,40.23 U2.85 ; v1(51.69,34.65) 51.82,34.52 51.82,34.44 U2.24 53.34,32.92 ; 46.53,46.27 45.72,45.46 45.72,45.44 45.59,45.31
  Top Layer w0.508: 93.63,18.18 93.58,18.23 ; 93.63,18.18 94.74,18.18 ; 93.63,18.18 92.37,18.18 92.33,18.14 ; 93.63,18.18 93.63,16.61 ; DC1.2 89.75,9.25 ; DC1.2 89.61,7.6 87.25,7.6 ; DC1.2 89.75,5.94 ; DC1.2 92.33,7.73 ; 96.01,25.25 USB1.2 98.8,25.25 ; 93.63,16.61 93.63,15.6 ; 93.63,16.61 91.82,16.61 ; USB1.2 93.63,23.68 93.58,23.63 ; USB1.2 95.12,25.25 ; USB1.2 91.95,25.25 ; 93.58,23.63 92.33,23.63 ; 93.58,23.63 94.87,23.63 ; 92.71,11.15 94.32,11.15 DC1.3 ; R3.2 94.31,32.11 ; R3.2 94.31,30.96 ; R3.2 93.85,31.6 93.22,32.23 U1.2 ; DC1.3 94.4,13.56 ; DC1.3 96.01,11.24 ; DC1.3 94.4,9.03 94.36,8.99 ; 97.43,16.61 97.43,15.34 ; 97.43,16.61 95.76,16.61 95.76,16.61 ; 97.43,16.61 97.43,17.63 ; 97.43,16.61 98.93,16.61
  Bottom Layer w0.127: RJ3.12 40.61,7.31 42.16,8.87 R19.2 ; RJ4.13 64.77,7.22 63.12,8.87 R28.2 ; R27.2 58.17,8.87 56.64,7.34 RJ4.12 ; R20.2 47.37,8.87 48.73,7.5 RJ3.13 ; 84.46,0.87 85.09,0.87
  Bottom Layer w0.203: C20.1 54.22,40.86 v1(53.97,40.62) ; C44.1 53.23,42.79 v1(52.71,42.27) ; v1(49.53,45.44) 50.43,46.34 C39.1
  Bottom Layer w0.254: C22.1 38.07,35.54 v1(37.47,35.54) ; v1(51.69,34.65) 51.69,35.89 C33.1 51.8,35.9 52.83,36.93 v1(53.85,36.93) ; C24.1 v1(48.26,31.2) ; 49.26,33.49 49.88,32.87 v1(49.91,32.87) ; v1(40.26,32.87) 40.78,33.39 C23.1
  Bottom Layer w0.508: 84.58,0.61 85.22,0.61
  Bottom Layer w1.27: DC1.3 94.4,8.61 ; DC1.3 94.4,13.53 94.36,13.56 94.49,13.56 ; DC1.3 95.93,11.24 ; RJ1.SHIELD1 4.7,15.85 ; DC1.2 89.75,8.74 89.79,8.74 ; DC1.2 89.75,6.58 ; DC1.2 87.12,7.73 ; 86.49,14.11 RJ5.SHIELD0 84.71,16.11
  vias: v1(1.4,13.95) v1(1.4,10.14) v1(1.4,6.33) v1(1.4,2.52) v1(1.52,57.63) v1(1.52,53.82) v1(1.52,50.01) v1(1.52,46.2) v1(1.52,42.39) v1(1.52,38.58) v1(1.52,34.77) v1(1.52,30.96) v1(1.52,27.15) v1(1.52,19.53) v1(5.21,2.52) v1(5.33,61.44) v1(5.33,57.63) v1(5.33,53.82) v1(5.33,50.01) v1(5.33,46.2) v1(5.33,42.39) v1(5.33,38.58) v1(5.33,34.77) v1(5.33,30.96) v1(5.33,27.15) v1(5.33,19.53) v1(9.02,13.95) v1(9.02,2.52) v1(9.14,61.44) v1(9.14,57.63) v1(9.14,53.82) v1(9.14,50.01) v1(9.14,46.2) v1(9.14,42.39) v1(9.14,38.58) v1(9.14,34.77) v1(9.14,30.96) v1(9.53,23.34) v1(11.94,23.34) v1(12.83,10.14) v1(12.83,6.33) v1(12.83,2.52) v1(12.95,61.44) v1(12.95,57.63) v1(14.73,26.9) v1(16.64,24.74) v1(16.64,2.52) v1(16.76,61.44) v1(16.76,50.01) v1(16.76,46.2) v1(16.76,38.58) v1(16.76,34.77) v1(16.76,31.98) v1(18.16,30.33) v1(18.67,26.77) v1(19.69,34.77) v1(20.45,2.52) v1(20.57,61.44) v1(20.57,50.01) v1(20.57,42.39) v1(20.57,38.58) v1(20.7,32.61) v1(22.35,30.33) v1(23.37,38.58) v1(24.26,13.95) v1(24.26,2.52) v1(24.38,61.44) v1(24.38,46.2) v1(24.38,42.39) v1(24.38,27.15) v1(24.38,23.34) v1(24.64,36.42) v1(24.64,32.61) v1(28.07,13.95) v1(28.19,61.44) v1(28.19,38.58) v1(28.19,30.96) v1(28.19,27.15) v1(31.88,13.95) v1(31.88,2.52) v1(32,61.44) v1(32,42.39) v1(32,38.58) v1(32,30.96) v1(34.29,25.38) v1(34.29,23.36) v1(35.69,57.63) v1(35.69,53.82) v1(35.69,2.52) v1(35.81,61.44) v1(35.81,23.34) v1(35.81,19.53) v1(37.08,25) v1(37.12,23.34) v1(39.5,13.95) v1(39.5,2.52) v1(39.62,61.44) v1(39.62,57.63) v1(39.62,53.82) v1(39.62,38.58) v1(41.15,31.98) v1(41.53,40.62) v1(42.19,37.19) v1(42.91,37.89) v1(42.88,36.47) v1(43.31,13.95) v1(43.31,10.14) v1(43.31,6.33) v1(43.31,2.52) v1(43.43,57.63) v1(43.43,53.82) v1(43.43,50.01) v1(43.43,42.39) v1(43.63,38.58) v1(43.6,37.17) v1(43.58,35.75) v1(44.2,29.19) v1(44.33,37.86) v1(44.3,36.45) v1(44.27,35.03) v1(44.35,39.27) v1(45.05,38.55) v1(45.02,37.14) v1(44.99,35.73) v1(44.96,34.31) v1(45.07,39.97) v1(45.59,28.81) v1(45.74,37.83) v1(45.71,36.42) v1(45.68,35) v1(45.77,39.25) v1(46.43,37.11) v1(46.41,35.7) v1(46.46,38.53) v1(47.13,36.39) v1(47.12,13.95) v1(47.12,10.14) v1(47.12,6.33) v1(47.12,2.52) v1(47.24,42.39) v1(47.15,37.81) v1(47.24,23.34) v1(47.85,37.08) v1(48.26,41.5) v1(50.93,13.95) v1(50.93,2.52) v1(51.05,57.63) v1(51.05,38.58) v1(51.05,19.53) v1(54.74,27.53) v1(54.74,13.95) v1(54.74,2.52) v1(54.86,57.63) v1(58.55,27.53) v1(58.55,13.95) v1(58.55,10.14) v1(58.55,6.33) v1(58.55,2.52) v1(58.67,48.87) v1(58.67,46.2) v1(58.67,42.39) v1(58.67,38.58) v1(58.67,34.77) v1(62.36,13.95) v1(62.36,10.14) v1(62.36,6.33) v1(62.48,57.63) v1(62.48,54.33) v1(62.48,48.87) v1(62.48,46.2) v1(62.48,42.39) v1(62.48,38.58) v1(62.48,34.77) v1(62.48,27.53) v1(63.63,54.33) v1(66.17,13.95) v1(66.29,61.44) v1(66.29,57.63) v1(66.29,34.77) v1(66.29,25.63) v1(66.29,23.34) v1(68.83,28.42) v1(70.1,61.44) v1(70.1,57.63) v1(70.1,53.82) v1(70.1,50.01) v1(70.1,46.2) v1(70.1,34.77) v1(70.1,23.34) v1(70.74,26.65) v1(72.26,30.96) v1(72.52,25) v1(73.79,13.95) v1(73.79,10.14) v1(73.91,61.44) v1(73.91,53.82) v1(73.91,46.2) v1(76.2,27.03) v1(77.6,13.95) v1(77.72,61.44) v1(77.72,57.63) v1(77.72,53.82) v1(77.72,34.77) v1(77.72,30.96) v1(78.36,23.34) v1(81.41,13.95) v1(81.53,61.44) v1(81.53,57.63) v1(81.53,53.82) v1(81.53,50.01) v1(81.53,46.2) v1(81.53,42.39) v1(81.53,34.77) v1(81.53,27.15) v1(81.53,23.34) v1(85.34,61.44) v1(85.34,57.63) v1(85.34,53.82) v1(85.34,50.01) v1(85.34,46.2) v1(85.34,42.39) v1(85.34,34.77) v1(88.77,9.63) v1(88.77,5.82) v1(89.15,61.44) v1(89.15,57.63) v1(89.15,53.82) v1(89.15,50.01) v1(89.15,46.2) v1(89.15,42.39) v1(89.15,19.53) v1(92.96,61.44) v1(92.96,57.63) v1(92.96,53.82) v1(92.96,50.01) v1(92.96,46.2) v1(92.96,42.39) v1(92.96,38.58) v1(92.96,34.77) v1(93.22,28.68) v1(96.27,30.71) v1(96.39,13.44) v1(96.39,9.63) v1(96.39,5.82) v1(96.77,57.63) v1(96.77,53.82) v1(96.77,50.01) v1(96.77,46.2) v1(96.77,42.39) v1(96.77,23.34) v1(96.77,19.53)
SVDDH: length 53.8
  Top Layer w0.203: U2.41 52.47,40.39 v1(53.34,41.25)
  Top Layer w0.254: 74.34,38.14 C43.2 ; 74.34,38.14 L7.2 ; 74.34,38.14 74.76,38.14 ; v1(56.26,46.08) 56.26,49.95 56.58,50.27 68.33,50.27 69.09,51.03 77.09,51.03 77.47,50.65 77.47,38.71 76.9,38.14 74.76,38.14 ; 74.76,38.14 74.8,38.19 74.55,38.44 TP10.1
  Bottom Layer w0.203: C44.2 53.34,41.4 v1(53.34,41.25)
  Bottom Layer w0.254: v1(56.26,46.08) 54.55,46.08 54.22,45.74 C44.2
SVDDL: length 9.4
  Top Layer w0.203: v1(56.13,41.76) 56.13,41.73 U2.37
  Bottom Layer w0.203: TP11.1 56.01,43.54 C45.2 ; C45.2 L8.2 ; C45.2 56.76,42.38 v1(56.13,41.76)
VBUS: length 34.5
  Top Layer w0.127: TP2.1 89.1,34.85 87.92,33.67
  Top Layer w0.254: R2.1 85.34,33.38 83.82,31.85 C7.2
  Top Layer w0.508: 87.67,32.23 85.6,32.23 83.95,30.58 83.95,26.52 85.85,24.61 85.85,18.14 86.11,17.88 F1.2 ; 87.67,32.23 87.69,32.25 R2.1 87.69,37.27 C6.1 ; 87.67,32.23 U1.5
VDDL: length 37.4
  Top Layer w0.203: v1(65.2,47.6) R6.1 ; v1(65.2,53.82) R5.1 60.66,55.3 58.55,53.19 53.94,53.19 ; v1(63.63,44.55) 65.2,46.12 ; TP3.1 53.94,53.19 ; 53.94,53.19 C8.2 53.94,53.24 C9.2 C10.2 51.1,54.26 L2.2
  Bottom Layer w0.203: L8.1 61.31,44.55 v1(63.63,44.55) ; v1(65.2,53.82) v1(65.2,47.6)
DISAUTOLOAD: length 28.3
  Top Layer w0.127: v1(41.78,42.78) 41.78,42.78 U2.76
  Bottom Layer w0.127: 31.55,49.76 29.18,49.76 TP14.1 ; 31.55,49.76 R11.1 ; 31.55,49.76 30.56,48.77 30.56,42.7 35.42,37.83 36.84,37.83 v1(41.78,42.78)
EN_PWRLIGHT: length 10.8
  Top Layer w0.127: U2.73 41.63,44.58 35.56,50.65 v1(35.56,51.03)
  Bottom Layer w0.127: v1(35.56,51.03) R12.1
EN_SWR: length 7.2
  Top Layer w0.127: U2.60 50.49,49.1 R14.1 50.79,49.1 TP16.1
HV_SWR: length 31.3
  Top Layer w0.203: 43.05,47.47 43.05,47.17 U2.66 ; 43.05,47.47 43.31,47.47 43.94,46.84 43.95,46.84 ; 43.05,47.47 42.16,48.36 42.16,61.19 42.67,61.7 45.16,61.7 L4.2
  Top Layer w0.254: L4.2 48.07,61.65 ; 48.07,61.65 51.43,61.65 ; 48.07,61.65 C28.2 ; C29.2 54.45,61.65 C30.2 56.54,61.62 TP6.1
NRST: length 20.6
  Top Layer w0.127: v1(29.21,45.95) 31.75,45.95 34.54,43.16 35.69,43.16 37.94,40.9 U2.86
  Bottom Layer w0.127: TP15.1 30.04,45.12 v1(29.21,45.95) 28.32,45.95 27.43,46.84 ; 27.13,47.14 27.43,46.84 ; 27.43,46.84 27.43,45.95 25.59,44.11 ; 25.59,44.11 27.06,42.65 C51.2 ; 25.59,44.11 D1.2
P0_LED0: length 85.7
  Top Layer w0.127: v1(20.45,23.85) 20.45,17.38 16.64,13.56 v1(11.94,13.56) ; v1(27.31,54.71) 27.87,54.71 38.77,43.81 38.77,42.96 U2.81
  Bottom Layer w0.127: v1(27.31,54.71) 15.11,54.71 13.39,52.99 13.39,30.91 v1(20.45,23.85) ; R21.1 R15.1 11.94,11.31 v1(11.94,13.56)
P0_LED1: length 85.1
  Top Layer w0.127: v1(14.61,14.2) 16.95,14.2 20.22,17.47 20.22,23.06 v1(19.43,23.85) ; U2.80 39.05,43.25 39.05,43.85 28.07,54.84 v1(28.07,55.47)
  Bottom Layer w0.127: v1(14.61,14.2) 13.41,13 R16.1 R22.2 ; v1(19.43,23.85) 13.16,30.13 13.16,53.08 15.55,55.47 v1(28.07,55.47) 28.19,55.47
P0MDIA_N: length 42.9
  Top Layer w0.213: U2.92 35.82,39.69 35.82,39.72 35.3,40.23 23.88,40.23 8.52,24.88 8.52,19.02 8.89,18.64 9.26,18.64 9.65,19.04 9.65,19.82 RJ1.P3 9.49,19.95
P0MDIA_P: length 43
  Top Layer w0.213: RJ1.P2 8.15,25.03 23.72,40.6 35.45,40.6 36.08,39.98 36.1,39.98 U2.91
P0MDIB_N: length 46.3
  Top Layer w0.213: U2.94 35.25,39.13 35.25,39.13 35.04,39.35 25.91,39.35 10.91,24.34 10.91,18.91 11.94,17.88 11.94,16.36 12.32,15.98 14.1,15.98 14.6,16.48 RJ1.P7
P0MDIB_P: length 46.2
  Top Layer w0.213: RJ1.P4 10.69,16.45 10.34,16.11 9.65,16.11 9.27,16.49 9.27,17.64 10.54,18.91 10.54,24.5 12.13,26.09 12.13,26.39 12.06,26.46 12.06,26.76 12.11,26.82 12.42,26.82 12.49,26.75 12.79,26.75 12.85,26.8 12.85,27.11 12.77,27.18 12.77,27.48 12.83,27.54 13.13,27.54 13.21,27.47 13.51,27.47 13.57,27.52 13.57,27.82 13.49,27.9 13.49,28.2 13.55,28.26 13.85,28.26 13.93,28.18 14.23,28.18 14.29,28.24 14.29,28.54 14.21,28.62 14.21,28.92 14.27,28.98 14.57,28.98 14.64,28.9 14.95,28.9 15,28.96 15,29.26 14.93,29.34 14.93,29.64 14.99,29.69 15.29,29.69 15.36,29.62 15.67,29.62 25.76,39.71 35.21,39.71 35.51,39.41 35.54,39.41 U2.93
P0MDIC_N: length 33.3
  Top Layer w0.213: RJ1.P6 13.21,17.43 13.21,23.21 25.09,35.09 34.76,35.09 34.95,35.28 34.97,35.28 U2.98
P0MDIC_P: length 33.3
  Top Layer w0.213: 35.18,36.05 34.69,35.56 34.69,35.53 34.61,35.46 24.94,35.46 20,30.52 19.7,30.52 19.68,30.53 19.38,30.53 19.32,30.47 19.32,30.17 19.34,30.16 19.34,29.85 19.28,29.8 18.98,29.8 18.96,29.81 18.66,29.81 18.6,29.75 18.6,29.45 18.62,29.44 18.62,29.14 18.56,29.08 18.26,29.08 18.24,29.09 17.94,29.09 17.88,29.04 17.88,28.73 17.9,28.72 17.9,28.42 17.84,28.36 17.54,28.36 17.53,28.38 17.22,28.38 17.17,28.32 17.17,28.02 17.18,28 17.18,27.7 17.12,27.64 16.82,27.64 16.81,27.66 16.5,27.66 16.45,27.6 16.45,27.3 16.46,27.28 16.46,26.98 12.84,23.36 12.84,20.73 RJ1.P5
P0MDID_N: length 30.5
  Top Layer w0.213: RJ1.P9 17.14,19.94 17.14,19.11 16.93,18.9 16.26,18.9 15.99,19.17 15.99,21.68 28.55,34.24 35.61,34.24 35.8,34.43 35.82,34.43 U2.101
P0MDID_P: length 30.4
  Top Layer w0.213: RJ1.P8 15.62,17.56 15.62,21.83 28.4,34.61 35.46,34.61 35.54,34.69 35.54,34.71 U2.100
P1_LED0: length 124
  Top Layer w0.127: U2.79 39.37,43.5 39.37,43.92 28.7,54.59 v1(28.7,55.98) ; v1(27.94,7.09) v1(27.94,2.64) 27.94,2.6
  Bottom Layer w0.127: v1(27.94,2.64) 27.14,1.84 3.47,1.84 2.92,2.39 2.92,20.16 12.93,30.17 12.93,53.17 15.86,56.11 28.57,56.11 v1(28.7,55.98) ; v1(27.94,7.09) 27.93,7.09 R23.1 R17.1
P1_LED1: length 127.5
  Top Layer w0.127: v1(29.46,56.62) 29.46,54.2 39.62,44.05 39.62,43.81 U2.78 ; v1(29.46,7.09) v1(29.46,2.64)
  Bottom Layer w0.127: v1(29.46,2.64) 29.46,2.39 28.69,1.61 3.37,1.61 2.69,2.29 2.69,20.32 12.7,30.33 12.7,53.32 16,56.62 v1(29.46,56.62) ; R18.1 R24.2 29.41,7.14 v1(29.46,7.09)
P1MDIA_N: length 22.3
  Top Layer w0.213: RJ2.P3 25.52,19.65 25.03,19.15 24.67,19.15 24.52,19.31 24.52,21.53 36.15,33.17 U2.104 36.67,33.58
P1MDIA_P: length 22.2
  Top Layer w0.213: U2.103 36.82,34.35 24.15,21.69 RJ2.P2
P1MDIB_N: length 27.8
  Top Layer w0.213: RJ2.P7 30.6,16.86 29.84,16.11 28.57,16.11 27.81,16.87 27.81,17.88 26.92,18.77 26.92,22.16 37.49,32.73 37.52,32.73 U2.107
P1MDIB_P: length 27.8
  Top Layer w0.213: RJ2.P4 26.8,17.31 26.8,16.11 26.42,15.72 25.78,15.72 25.4,16.11 25.4,17.63 26.56,18.79 26.56,22.31 26.76,22.51 26.76,22.81 26.73,22.84 26.73,23.15 26.78,23.2 27.09,23.2 27.12,23.17 27.42,23.17 27.48,23.23 27.48,23.53 27.44,23.56 27.44,23.86 27.5,23.92 27.8,23.92 27.83,23.89 28.14,23.89 28.19,23.95 28.19,24.25 28.16,24.28 28.16,24.58 28.22,24.64 28.52,24.64 28.55,24.61 28.85,24.61 28.91,24.67 28.91,24.97 28.88,25 28.88,25.3 28.94,25.36 29.24,25.36 29.27,25.33 29.57,25.33 29.63,25.39 29.63,25.69 29.6,25.72 29.6,26.02 29.66,26.08 29.96,26.08 29.99,26.05 30.29,26.05 37.23,32.99 37.23,33.01 U2.106
P1MDIC_N: length 19
  Top Layer w0.213: U2.110 38.37,31.88 38.34,31.88 29.21,22.75 29.21,17.43 RJ2.P6
P1MDIC_P: length 19
  Top Layer w0.213: 38.57,32.66 38.08,32.16 38.08,32.14 36.44,30.5 36.08,30.5 35.9,30.32 35.9,29.96 35.72,29.78 35.36,29.78 35.18,29.6 35.18,29.24 35,29.06 34.64,29.06 34.47,28.88 34.47,28.52 34.29,28.34 33.93,28.34 33.75,28.16 33.75,27.8 33.57,27.62 33.21,27.62 33.03,27.44 33.03,27.09 32.85,26.91 32.49,26.91 32.31,26.73 32.31,26.37 32.13,26.19 31.77,26.19 31.59,26.01 31.59,25.65 31.41,25.47 31.05,25.47 30.87,25.29 30.87,24.93 30.69,24.75 30.33,24.75 30.15,24.57 30.15,24.21 28.84,22.9 28.84,20.73 RJ2.P5
P1MDID_N: length 17.9
  Top Layer w0.213: U2.113 39.21,31.03 39.19,31.03 38.88,30.72 38.23,30.72 32.14,24.64 32.14,19.15 32.38,18.9 32.93,18.9 33.15,19.11 33.15,19.94 RJ2.P9
P1MDID_P: length 17.9
  Top Layer w0.213: U2.112 38.93,31.32 38.93,31.29 38.73,31.09 38.08,31.09 31.77,24.79 RJ2.P8
P2_LED0: length 146.5
  Top Layer w0.127: U2.75 30.86,54.27 v1(30.86,58.02) ; v1(43.94,7.22) 44.07,7.09 v1(44.07,1.5)
  Bottom Layer w0.127: v1(43.94,7.22) 43.94,8.81 R19.1 R25.1 ; v1(30.86,58.02) 16.75,58.02 12.24,53.51 12.24,30.58 2.23,20.57 2.23,2.1 3.18,1.16 10.56,1.16 10.57,1.14 43.71,1.14 v1(44.07,1.5)
P2_LED1: length 144.7
  Top Layer w0.127: v1(44.7,2.9) 44.7,6.45 v1(45.47,7.22) ; 40.55,43.44 39.88,44.12 39.88,44.3 30.1,54.08 v1(30.1,57.25)
  Bottom Layer w0.127: v1(45.47,7.22) 45.47,8.81 R20.1 R26.2 ; v1(44.7,2.9) 43.19,1.39 3.28,1.39 2.46,2.2 2.46,20.47 12.47,30.48 12.47,53.41 16.21,57.15 16.64,57.14 29.99,57.14 v1(30.1,57.25)
P2MDIA_N: length 14.3
  Top Layer w0.213: RJ3.P3 41.49,19.11 41.28,18.9 40.7,18.9 40.49,19.11 40.49,21.85 39.25,23.09 39.25,27.53 40.13,28.41 40.13,29.15 40.6,29.62 40.63,29.62 U2.118
P2MDIA_P: length 14.3
  Top Layer w0.213: RJ3.P2 40.12,21.69 38.88,22.93 38.88,27.68 39.77,28.57 39.77,29.3 40.35,29.88 40.35,29.9 U2.117
P2MDIB_N: length 20
  Top Layer w0.213: 41.97,29.26 41.48,28.77 41.45,28.77 41.38,28.69 41.38,23.5 42.88,22 42.88,18.95 43.94,17.88 43.94,16.87 44.58,16.23 46.1,16.23 46.57,16.7 RJ3.P7
P2MDIB_P: length 20
  Top Layer w0.213: RJ3.P4 42.66,15.76 42.37,15.47 41.77,15.47 41.4,15.84 41.4,18.26 42.51,19.37 42.51,21.84 41.01,23.34 41.01,27.12 40.8,27.33 40.11,27.33 39.9,27.55 39.9,27.63 40.11,27.84 40.8,27.84 41.01,28.06 41.01,28.85 41.19,29.03 41.19,29.05 U2.120
P2MDIC_N: length 12.5
  Top Layer w0.213: U2.124 42.32,27.92 42.3,27.92 42.23,27.85 42.23,25.06 45.2,22.09 RJ3.P6
P2MDIC_P: length 12.5
  Top Layer w0.213: 42.53,28.69 42.04,28.2 42.04,28.18 41.86,28 41.86,24.91 42.66,24.11 42.66,23.8 42.45,23.59 42.45,23.29 42.51,23.23 42.81,23.23 43.02,23.44 43.32,23.44 43.38,23.39 43.38,23.09 43.17,22.87 43.17,22.57 43.22,22.51 43.53,22.51 43.74,22.73 44.04,22.73 44.84,21.93 44.84,20.75 RJ3.P5
P2MDID_N: length 12.8
  Top Layer w0.213: 49.15,19.91 49.15,19.15 48.9,18.9 48.39,18.9 48.11,19.17 48.11,20.45 43,25.57 43,26.9 U2.127
P2MDID_P: length 12.9
  Top Layer w0.213: RJ3.P8 47.75,17.42 47.75,20.3 42.63,25.42 42.63,27.07 42.89,27.33 42.89,27.36 43.38,27.85
P3_LED0: length 184.6
  Top Layer w0.127: U2.74 41.4,44.3 35.04,50.66 35.04,59.14 v1(35.05,59.16) ; v1(59.94,7.34) 59.94,2.77 v1(60.71,2.01)
  Bottom Layer w0.127: 59.91,11.39 59.91,8.87 59.94,8.84 v1(59.94,7.34) ; v1(60.71,2.01) 76.71,2.01 77.47,1.25 91.95,1.25 93.29,2.59 93.29,14.22 95.21,16.14 95.21,62.03 93.8,63.44 93.77,63.43 93.76,63.44 63.08,63.44 61.98,62.34 61.98,60.31 61.81,60.14 36.03,60.14 v1(35.05,59.16)
P3_LED1: length 179.6
  Top Layer w0.127: 41.97,44.86 36.32,50.5 v1(36.32,59.16) ; v1(63.5,2.64) 61.91,2.64 61.47,3.09 v1(61.47,7.34)
  Bottom Layer w0.127: R32.2 61.43,8.88 R28.1 61.42,7.39 v1(61.47,7.34) ; v1(63.5,2.64) 76.84,2.64 77.86,1.61 91.81,1.61 93.07,2.87 93.07,14.31 94.98,16.23 94.98,61.93 93.71,63.21 63.23,63.21 62.24,62.22 62.24,60.24 61.91,59.91 37.07,59.91 v1(36.32,59.16)
P3MDIA_N: length 16.5
  Top Layer w0.213: RJ4.P3 57.53,19.37 57.31,19.15 56.77,19.15 56.52,19.4 56.52,21.57 55.38,22.71 51.65,22.71 47.03,27.33 47.03,27.36 46.53,27.85
P3MDIA_P: length 16.5
  Top Layer w0.213: RJ4.P2 56.16,21.42 55.23,22.34 51.5,22.34 46.77,27.07 46.74,27.07 U2.2
P3MDIB_N: length 26.1
  Top Layer w0.213: U2.5 47.59,27.92 47.59,27.9 51.76,23.72 57.05,23.72 58.91,21.86 58.91,18.91 59.94,17.88 59.94,16.87 60.45,16.36 62.1,16.36 62.61,16.86 RJ4.P7
P3MDIB_P: length 26.3
  Top Layer w0.213: U2.4 47.31,27.64 47.33,27.64 51.61,23.36 56.9,23.36 57.08,23.17 57.08,22.87 56.81,22.59 56.81,22.29 56.86,22.23 57.17,22.23 57.44,22.51 57.75,22.51 57.8,22.45 57.8,22.15 57.53,21.87 57.53,21.57 57.58,21.51 57.88,21.51 58.16,21.79 58.46,21.79 58.55,21.71 58.55,19.28 57.18,17.91 57.18,15.95 57.53,15.6 58.32,15.6 58.7,15.97 RJ4.P4
P3MDIC_N: length 21.9
  Top Layer w0.213: 47.95,29.26 48.44,28.77 48.44,28.75 52.06,25.12 59.84,25.12 61.24,23.73 RJ4.P6
P3MDIC_P: length 22
  Top Layer w0.213: RJ4.P5 60.87,20.75 60.87,23.58 59.69,24.76 59.11,24.76 58.9,24.54 58.9,24.07 58.68,23.85 58.6,23.85 58.39,24.07 58.39,24.54 58.18,24.76 58.09,24.76 57.88,24.54 57.88,24.07 57.67,23.85 57.59,23.85 57.37,24.07 57.37,24.54 57.16,24.76 51.91,24.76 48.18,28.49 48.16,28.49 U2.7
P3MDID_N: length 24.9
  Top Layer w0.213: RJ4.P9 65.15,19.94 65.15,19.49 64.94,19.28 64.21,19.28 63.99,19.49 63.99,25.16 62.64,26.52 51.8,26.52 49,29.31 49,29.34 U2.10
P3MDID_P: length 24.9
  Top Layer w0.213: U2.9 48.72,29.05 48.75,29.05 51.65,26.15 62.48,26.15 63.63,25.01 63.63,17.56 RJ4.P8
P4_LED0: length 159
  Top Layer w0.127: v1(75.82,7.47) 75.82,4.42 77.47,2.77 v1(78.49,2.77) ; 42.53,45.42 42.53,45.45 37.85,50.14 v1(37.85,59.16)
  Bottom Layer w0.127: v1(37.85,59.16) 38.14,59.45 62.09,59.45 62.7,60.06 62.7,61.87 63.58,62.75 93.52,62.75 94.53,61.74 94.53,27.95 92.49,25.92 92.49,3.57 91.69,2.77 v1(78.49,2.77) ; v1(75.82,7.47) 75.82,8.81 75.87,8.87 75.87,11.41
P4_LED1: length 159.9
  Top Layer w0.127: v1(37.08,59.16) 37.08,50.27 42.13,45.22 ; v1(77.47,7.47) 77.47,4.68 v1(80.01,2.13)
  Bottom Layer w0.127: v1(77.47,7.47) 77.47,8.81 R34.2 R30.1 ; v1(37.08,59.16) 37.6,59.68 62,59.68 62.47,60.15 62.47,62.07 63.39,62.98 93.61,62.98 94.75,61.84 94.75,16.32 92.84,14.41 92.84,3.28 91.69,2.13 v1(80.01,2.13)
P4MDIA_N: length 30
  Top Layer w0.213: RJ5.P3 73.53,19.37 73.31,19.15 72.72,19.15 72.5,19.37 72.5,22.86 66.57,28.79 56.85,28.79 52.68,32.95 U2.23
P4MDIA_P: length 29.9
  Top Layer w0.213: U2.22 51.91,33.16 56.65,28.42 66.42,28.42 72.14,22.71 72.14,17.43 RJ5.P2
P4MDIB_N: length 40.7
  Top Layer w0.213: RJ5.P7 78.61,16.86 78.1,16.36 76.45,16.36 75.95,16.87 75.95,17.88 74.93,18.9 74.93,25.26 69.73,30.46 56.91,30.46 53.53,33.84 53.53,33.86 U2.26
P4MDIB_P: length 40.8
  Top Layer w0.213: RJ5.P4 74.7,15.97 74.33,15.6 73.53,15.6 73.18,15.95 73.18,17.66 74.55,19.03 74.55,25.12 72.84,26.83 72.53,26.83 72.39,26.69 72.09,26.69 72.03,26.75 72.03,27.05 72.18,27.19 72.18,27.5 72.12,27.55 71.82,27.55 71.67,27.41 71.37,27.41 71.31,27.47 71.31,27.77 71.46,27.91 71.46,28.21 71.4,28.27 71.1,28.27 70.95,28.13 70.65,28.13 70.59,28.19 70.59,28.49 70.74,28.63 70.74,28.93 69.58,30.09 56.76,30.09 53.27,33.58 53.25,33.58 U2.25
P4MDIC_N: length 35.1
  Top Layer w0.213: RJ5.P6 77.32,17.49 77.32,24.63 70.14,31.82 57.24,31.82 54.38,34.69 54.38,34.71 U2.29
P4MDIC_P: length 35.1
  Top Layer w0.213: U2.28 54.1,34.43 54.12,34.43 57.09,31.45 69.99,31.45 76.96,24.48 76.96,24.08 76.74,23.86 76.29,23.86 76.08,23.65 76.08,23.57 76.29,23.36 76.74,23.36 76.96,23.14 76.96,23.06 76.74,22.85 76.29,22.85 76.08,22.64 76.08,22.55 76.29,22.34 76.74,22.34 76.96,22.13 76.96,20.84 RJ5.P5
P4MDID_N: length 37.3
  Top Layer w0.213: U2.31 54.94,35.28 54.94,35.25 57.58,32.61 72.41,32.61 80,25.03 80,19.55 80.26,19.28 80.93,19.28 81.15,19.49 RJ5.P9
P4MDID_P: length 37.4
  Top Layer w0.213: RJ5.P8 79.63,17.56 79.63,24.88 72.26,32.25 57.43,32.25 54.69,34.99 54.66,34.99 U2.30
PLLGND: length 13.6
  Top Layer w0.127: v1(37.59,27.41) 37.59,28.07 39.62,30.1 39.62,30.31 U2.115
  Bottom Layer w0.127: 34.02,29.2 35.29,27.93 C48.1 36.56,26.38 ; v1(37.59,27.41) 36.56,26.38 ; 36.56,26.38 38.58,24.36 TP13.1
PLLVDDL: length 12.5
  Top Layer w0.203: U2.114 39.99,31.2 v1(38.74,29.95) 35.56,26.77 v1(35.56,25.5)
  Bottom Layer w0.127: TP12.1 37.99,29.2 v1(38.74,29.95) ; 35.57,25.39 C48.2 33.03,27.93 32.75,27.93
V_BUS: length 13.1
  Top Layer w0.508: 93.58,22.43 94.33,22.43 94.74,22.02 94.74,19.92 94.26,19.43 91.77,19.43 F1.1 90.17,17.83 90.17,14.16 DC1.1
XTAL_IN: length 10.7
  Top Layer w0.254: 38.57,41.47 36.5,43.54 34.67,43.54 32.99,45.22 32.99,46.31 32.33,46.97 31.75,46.97 C50.2
XTAL_OUT: length 10.1
  Top Layer w0.254: 32.5,49.01 32.88,49.01 35.08,46.81 35.08,45.85 38.14,42.78 38.14,42.46 U2.83
$1N2005: length 2.5
  Top Layer w0.127: 49.36,30.67 49.36,30.62 51.13,28.86
$1N2999: length 8.3
  Top Layer w0.203: 45.97,46.84 47.13,48 L2.1 47.5,49.91 47.5,47.8 U2.63
$1N4938: length 1.4
  Top Layer w0.254: 95.18,31.6 95.18,33
$1N4945: length 5.2
  Top Layer w0.254: U1.3 93.69,34.39 R1.2 ; R1.2 94.31,35.68 C5.2 ; R1.2 R4.1
$1N4947: length 1.7
  Top Layer w0.254: R2.2 89.22,33.38 89.41,33.18 U1.4
$1N4948: length 2.2
  Top Layer w0.254: C1.1 92.48,29.7 U1.1
$1N4949: length 9.7
  Top Layer w0.254: C1.2 90.42,29.79 90.42,31.04 U1.6
  Top Layer w0.508: U1.6 86.17,31.28 85.6,30.71 85.6,28.22 L1.1
$1N9816: length 3.7
  Top Layer w0.127: R9.1 91.19,21.19 91.95,20.42 93.57,20.42 93.58,20.43
$1N9819: length 4
  Top Layer w0.127: 93.58,21.43 93.57,21.44 92.33,21.44 90.93,22.84 R10.2
$1N10186: length 10.1
  Top Layer w0.127: R8.2 98.04,26.14 90.42,26.14 90.2,25.91 LED1.2
$2N645: length 4.1
  Bottom Layer w0.127: RJ1.12 8.64,7.22 10.29,8.87 11.04,8.87
$2N647: length 4.3
  Bottom Layer w0.127: R22.1 15.24,8.87 16.76,7.34 RJ1.13
$2N653: length 3.5
  Bottom Layer w0.127: RJ1.P1 6.87,18.02 6.35,17.5 C52.2
$2N1076: length 4.2
  Bottom Layer w0.127: RJ2.12 24.64,7.22 26.29,8.87 R23.2
$2N1078: length 4.3
  Bottom Layer w0.127: RJ2.13 32.77,7.34 31.24,8.87 R24.1
$2N1084: length 3.4
  Bottom Layer w0.127: C53.2 22.35,17.5 22.87,18.02 RJ2.P1
$2N1523: length 3.5
  Bottom Layer w0.127: C54.2 38.35,17.5 38.84,17.99 38.84,19.95
$2N1954: length 3.4
  Bottom Layer w0.127: C55.2 54.42,17.5 54.87,17.96 RJ4.P1
$2N2377: length 4.2
  Bottom Layer w0.127: R33.2 74.17,8.87 72.64,7.34 RJ5.12
$2N2379: length 4.2
  Bottom Layer w0.127: R34.1 79.12,8.87 80.77,7.22 RJ5.13
$2N2385: length 3.6
  Bottom Layer w0.127: C56.2 70.42,17.5 70.88,17.95 RJ5.P1
$2N6448: length 7.9
  Bottom Layer w0.127: RJ3.11 38.07,7.31 42.05,11.29 R25.2
$2N6531: length 7.8
  Bottom Layer w0.127: R31.2 58.15,11.39 54.1,7.34 RJ4.11
$2N6555: length 7.8
  Bottom Layer w0.127: R26.1 47.32,11.29 51.27,7.34 RJ3.14
$2N6593: length 7.8
  Bottom Layer w0.127: R32.1 63.13,11.39 67.31,7.22 RJ4.14

## Copper pours and planes (outline as drawn; the poured copper is in the pictures)
GND on Top Layer: -2.29,67.16 104.01,67.16 104.01,15.72 -2.29,15.72
GND on Top Layer: 84.96,20.11 101.22,20.11 101.22,-1.8 84.96,-1.8
GND on Top Layer: -2.41,15.34 84.71,15.34 84.71,-1.29 -2.41,-1.29
GND on Bottom Layer: -1.4,65.76 101.22,65.76 101.22,15.72 -1.4,15.72
